# Altium schematic sheet main.SchDoc
size A4
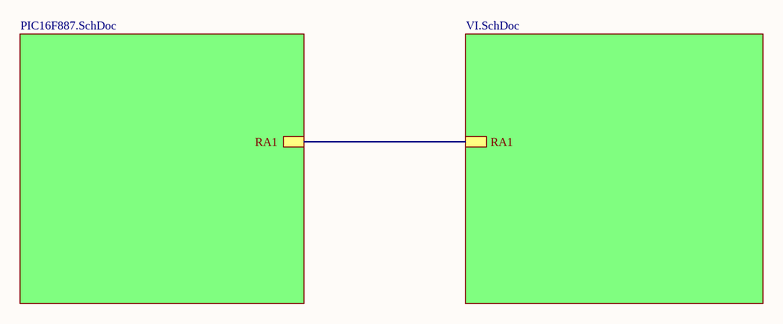
[diagram p0: main.SchDoc]

## Sub-sheets
Designator = PIC16F887.SchDoc: RA1
Designator = VI.SchDoc: RA1

## Nets
(unnamed): sheet Designator/RA1, sheet Designator/RA1